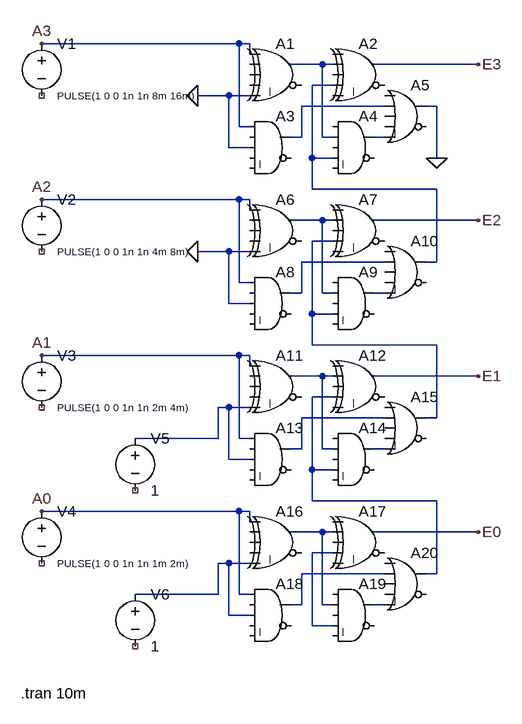
[diagram p0: schematic BCDtoE3.asc]
BCDtoE3.asc, the LTspice schematic file:
Version 4.1
SHEET 1 880 1112
WIRE 112 96 -192 96
WIRE 128 96 112 96
WIRE 128 112 128 96
WIRE 240 128 192 128
WIRE 256 128 240 128
WIRE 480 128 320 128
WIRE 256 160 224 160
WIRE 96 176 48 176
WIRE 128 176 96 176
WIRE 336 192 208 192
WIRE 416 192 400 192
WIRE 112 224 112 96
WIRE 128 224 112 224
WIRE 208 240 208 192
WIRE 208 240 192 240
WIRE 240 240 240 128
WIRE 256 240 240 240
WIRE 336 240 320 240
WIRE 96 256 96 176
WIRE 128 256 96 256
WIRE 224 272 224 160
WIRE 256 272 224 272
WIRE 416 272 416 192
WIRE 224 320 224 272
WIRE 416 320 224 320
WIRE 112 336 -192 336
WIRE 128 336 112 336
WIRE 128 352 128 336
WIRE 240 368 192 368
WIRE 256 368 240 368
WIRE 480 368 320 368
WIRE 256 400 224 400
WIRE 96 416 48 416
WIRE 128 416 96 416
WIRE 336 432 208 432
WIRE 416 432 416 320
WIRE 416 432 400 432
WIRE 112 464 112 336
WIRE 128 464 112 464
WIRE 208 480 208 432
WIRE 208 480 192 480
WIRE 240 480 240 368
WIRE 256 480 240 480
WIRE 336 480 320 480
WIRE 96 496 96 416
WIRE 128 496 96 496
WIRE 224 512 224 400
WIRE 256 512 224 512
WIRE 224 560 224 512
WIRE 416 560 224 560
WIRE 112 576 -192 576
WIRE 128 576 112 576
WIRE 128 592 128 576
WIRE 240 608 192 608
WIRE 256 608 240 608
WIRE 480 608 320 608
WIRE 256 640 224 640
WIRE 96 656 80 656
WIRE 128 656 96 656
WIRE 336 672 208 672
WIRE 416 672 416 560
WIRE 416 672 400 672
WIRE 80 704 80 656
WIRE 80 704 -48 704
WIRE 112 704 112 576
WIRE 128 704 112 704
WIRE 208 720 208 672
WIRE 208 720 192 720
WIRE 240 720 240 608
WIRE 256 720 240 720
WIRE 336 720 320 720
WIRE 96 736 96 656
WIRE 128 736 96 736
WIRE 224 752 224 640
WIRE 256 752 224 752
WIRE 224 800 224 752
WIRE 416 800 224 800
WIRE 112 816 -192 816
WIRE 128 816 112 816
WIRE 128 832 128 816
WIRE 240 848 192 848
WIRE 256 848 240 848
WIRE 480 848 320 848
WIRE 256 880 224 880
WIRE 96 896 80 896
WIRE 128 896 96 896
WIRE 336 912 208 912
WIRE 416 912 416 800
WIRE 416 912 400 912
WIRE 80 944 80 896
WIRE 80 944 -48 944
WIRE 112 944 112 816
WIRE 128 944 112 944
WIRE 208 960 208 912
WIRE 208 960 192 960
WIRE 240 960 240 848
WIRE 256 960 240 960
WIRE 336 960 320 960
WIRE 96 976 96 896
WIRE 128 976 96 976
WIRE 224 992 224 880
WIRE 256 992 224 992
FLAG 48 176 0
FLAG 48 416 0
FLAG 416 272 0
FLAG -192 96 A3
FLAG -192 336 A2
FLAG -192 576 A1
FLAG -192 816 A0
FLAG 480 128 E3
FLAG 480 368 E2
FLAG 480 608 E1
FLAG 480 848 E0
SYMBOL Digital\\xor 176 80 R0
SYMATTR InstName A1
SYMBOL Digital\\xor 304 80 R0
SYMATTR InstName A2
SYMBOL Digital\\and 160 192 R0
SYMATTR InstName A3
SYMBOL Digital\\and 288 192 R0
SYMATTR InstName A4
SYMBOL Digital\\or 368 144 R0
SYMATTR InstName A5
SYMBOL voltage -192 80 R0
WINDOW 3 24 96 Left 1
WINDOW 123 0 0 Left 0
WINDOW 39 0 0 Left 0
SYMATTR InstName V1
SYMATTR Value PULSE(1 0 0 1n 1n 8m 16m)
SYMBOL voltage -192 320 R0
WINDOW 3 24 96 Left 1
WINDOW 123 0 0 Left 0
WINDOW 39 0 0 Left 0
SYMATTR InstName V2
SYMATTR Value PULSE(1 0 0 1n 1n 4m 8m)
SYMBOL voltage -192 560 R0
WINDOW 3 24 96 Left 1
WINDOW 123 0 0 Left 0
WINDOW 39 0 0 Left 0
SYMATTR InstName V3
SYMATTR Value PULSE(1 0 0 1n 1n 2m 4m)
SYMBOL voltage -192 800 R0
WINDOW 3 24 96 Left 1
WINDOW 123 0 0 Left 0
WINDOW 39 0 0 Left 0
SYMATTR InstName V4
SYMATTR Value PULSE(1 0 0 1n 1n 1m 2m)
SYMBOL Digital\\xor 176 320 R0
SYMATTR InstName A6
SYMBOL Digital\\xor 304 320 R0
SYMATTR InstName A7
SYMBOL Digital\\and 160 432 R0
SYMATTR InstName A8
SYMBOL Digital\\and 288 432 R0
SYMATTR InstName A9
SYMBOL Digital\\or 368 384 R0
SYMATTR InstName A10
SYMBOL Digital\\xor 176 560 R0
SYMATTR InstName A11
SYMBOL Digital\\xor 304 560 R0
SYMATTR InstName A12
SYMBOL Digital\\and 160 672 R0
SYMATTR InstName A13
SYMBOL Digital\\and 288 672 R0
SYMATTR InstName A14
SYMBOL Digital\\or 368 624 R0
SYMATTR InstName A15
SYMBOL Digital\\xor 176 800 R0
SYMATTR InstName A16
SYMBOL Digital\\xor 304 800 R0
SYMATTR InstName A17
SYMBOL Digital\\and 160 912 R0
SYMATTR InstName A18
SYMBOL Digital\\and 288 912 R0
SYMATTR InstName A19
SYMBOL Digital\\or 368 864 R0
SYMATTR InstName A20
SYMBOL voltage -48 688 R0
WINDOW 123 0 0 Left 0
WINDOW 39 0 0 Left 0
SYMATTR InstName V5
SYMATTR Value 1
SYMBOL voltage -48 928 R0
WINDOW 123 0 0 Left 0
WINDOW 39 0 0 Left 0
SYMATTR InstName V6
SYMATTR Value 1
TEXT -224 1096 Left 2 !.tran 10m

The netlist it stands for:
* BCDtoE3.asc
A1 A3 0 0 0 0 0 N001 0 XOR
A2 0 N001 0 N002 0 0 E3 0 XOR
A3 A3 0 0 0 0 0 N003 0 AND
A4 0 N001 0 N002 0 0 N004 0 AND
A5 0 N003 0 0 N004 0 0 0 OR
V1 A3 NC_01 PULSE(1 0 0 1n 1n 8m 16m)
V2 A2 NC_02 PULSE(1 0 0 1n 1n 4m 8m)
V3 A1 NC_03 PULSE(1 0 0 1n 1n 2m 4m)
V4 A0 NC_04 PULSE(1 0 0 1n 1n 1m 2m)
A6 A2 0 0 0 0 0 N005 0 XOR
A7 0 N005 0 N006 0 0 E2 0 XOR
A8 A2 0 0 0 0 0 N007 0 AND
A9 0 N005 0 N006 0 0 N008 0 AND
A10 0 N007 0 0 N008 0 N002 0 OR
A11 A1 0 0 0 N011 0 N009 0 XOR
A12 0 N009 0 N010 0 0 E1 0 XOR
A13 A1 0 N011 0 0 0 N012 0 AND
A14 0 N009 0 N010 0 0 N013 0 AND
A15 0 N012 0 0 N013 0 N006 0 OR
A16 A0 0 0 0 N016 0 N014 0 XOR
A17 0 N014 0 N015 0 0 E0 0 XOR
A18 A0 0 N016 0 0 0 N017 0 AND
A19 0 N014 0 N015 0 0 N018 0 AND
A20 0 N017 0 0 N018 0 N010 0 OR
V5 N011 NC_05 1
V6 N016 NC_06 1
.tran 10m
.backanno
.end